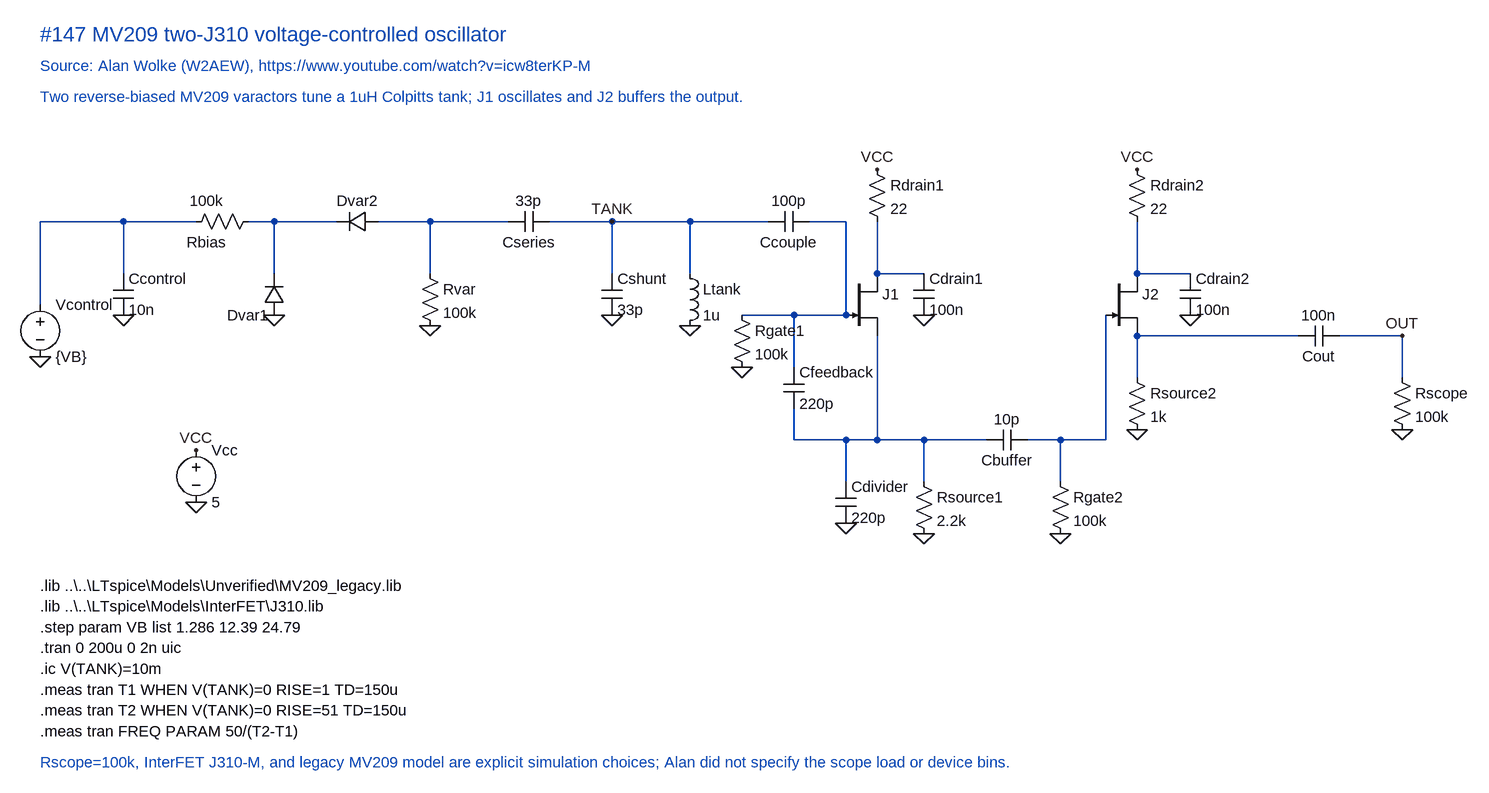
[diagram p0: schematic MV209 two-J310 VCO.asc]
MV209 two-J310 VCO.asc, the LTspice schematic file:
Version 4.1
SHEET 1 2450 1050
WIRE 128 0 0 0
WIRE 240 0 128 0
WIRE 360 0 320 0
WIRE 456 0 360 0
WIRE 600 0 520 0
WIRE 720 0 600 0
WIRE 880 0 784 0
WIRE 1000 0 880 0
WIRE 1120 0 1000 0
WIRE 1240 0 1184 0
WIRE 0 128 0 0
WIRE 128 80 128 0
WIRE 360 80 360 0
WIRE 600 80 600 0
WIRE 880 80 880 0
WIRE 1000 80 1000 0
WIRE 1240 144 1240 0
WIRE 1080 144 1160 144
WIRE 1160 144 1240 144
WIRE 1160 224 1160 144
WIRE 1288 80 1288 0
WIRE 1360 80 1288 80
WIRE 1288 176 1288 336
WIRE 1160 336 1160 288
WIRE 1240 336 1160 336
WIRE 1288 336 1240 336
WIRE 1360 336 1288 336
WIRE 1456 336 1360 336
WIRE 1570 336 1520 336
WIRE 1640 336 1570 336
WIRE 1640 144 1640 336
WIRE 1570 400 1570 336
WIRE 1240 400 1240 336
WIRE 1360 400 1360 336
WIRE 1688 80 1688 0
WIRE 1770 80 1688 80
WIRE 1688 240 1688 176
WIRE 1936 176 1688 176
WIRE 2096 176 2000 176
WIRE 2096 240 2096 176
FLAG 0 208 0
FLAG 128 144 0
FLAG 360 144 0
FLAG 600 160 0
FLAG 880 144 0
FLAG 1000 160 0
FLAG 1080 224 0
FLAG 1360 144 0
FLAG 1240 464 0
FLAG 1360 480 0
FLAG 1570 480 0
FLAG 1770 144 0
FLAG 1688 320 0
FLAG 2096 320 0
FLAG 2096 176 OUT
FLAG 880 0 TANK
FLAG 1288 -80 VCC
FLAG 1688 -80 VCC
FLAG 240 352 VCC
FLAG 240 432 0
SYMBOL voltage 0 112 R0
SYMATTR InstName Vcontrol
SYMATTR Value {VB}
SYMBOL cap 112 80 R0
SYMATTR InstName Ccontrol
SYMATTR Value 10n
SYMBOL res 224 16 R270
WINDOW 0 0 32 VBottom 2
WINDOW 3 32 32 VTop 2
SYMATTR InstName Rbias
SYMATTR Value 100k
SYMBOL diode 376 144 R180
WINDOW 3 0 0 Invisible 2
SYMATTR InstName Dvar1
SYMATTR Value MV209_LEGACY
SYMBOL diode 520 -16 R90
WINDOW 0 0 32 VBottom 2
WINDOW 3 0 0 Invisible 2
SYMATTR InstName Dvar2
SYMATTR Value MV209_LEGACY
SYMBOL res 584 64 R0
SYMATTR InstName Rvar
SYMATTR Value 100k
SYMBOL cap 720 16 R270
WINDOW 0 0 32 VBottom 2
WINDOW 3 32 32 VTop 2
SYMATTR InstName Cseries
SYMATTR Value 33p
SYMBOL cap 864 80 R0
SYMATTR InstName Cshunt
SYMATTR Value 33p
SYMBOL ind 984 64 R0
SYMATTR InstName Ltank
SYMATTR Value 1u
SYMBOL cap 1120 16 R270
WINDOW 0 0 32 VBottom 2
WINDOW 3 32 32 VTop 2
SYMATTR InstName Ccouple
SYMATTR Value 100p
SYMBOL res 1064 128 R0
SYMATTR InstName Rgate1
SYMATTR Value 100k
SYMBOL res 1272 -96 R0
SYMATTR InstName Rdrain1
SYMATTR Value 22
SYMBOL njf 1240 80 R0
WINDOW 3 0 0 Invisible 2
SYMATTR InstName J1
SYMATTR Value J310-M
SYMBOL cap 1344 80 R0
SYMATTR InstName Cdrain1
SYMATTR Value 100n
SYMBOL cap 1144 224 R0
SYMATTR InstName Cfeedback
SYMATTR Value 220p
SYMBOL cap 1224 400 R0
SYMATTR InstName Cdivider
SYMATTR Value 220p
SYMBOL res 1344 384 R0
SYMATTR InstName Rsource1
SYMATTR Value 2.2k
SYMBOL cap 1456 352 R270
WINDOW 0 0 32 VBottom 2
WINDOW 3 32 32 VTop 2
SYMATTR InstName Cbuffer
SYMATTR Value 10p
SYMBOL res 1554 384 R0
SYMATTR InstName Rgate2
SYMATTR Value 100k
SYMBOL res 1672 -96 R0
SYMATTR InstName Rdrain2
SYMATTR Value 22
SYMBOL njf 1640 80 R0
WINDOW 3 0 0 Invisible 2
SYMATTR InstName J2
SYMATTR Value J310-M
SYMBOL cap 1754 80 R0
SYMATTR InstName Cdrain2
SYMATTR Value 100n
SYMBOL res 1672 224 R0
SYMATTR InstName Rsource2
SYMATTR Value 1k
SYMBOL cap 1936 192 R270
WINDOW 0 0 32 VBottom 2
WINDOW 3 32 32 VTop 2
SYMATTR InstName Cout
SYMATTR Value 100n
SYMBOL res 2080 224 R0
SYMATTR InstName Rscope
SYMATTR Value 100k
SYMBOL voltage 240 336 R0
SYMATTR InstName Vcc
SYMATTR Value 5
TEXT 0 -288 Left 3 ;#147 MV209 two-J310 voltage-controlled oscillator
TEXT 0 -240 Left 2 ;Source: Alan Wolke (W2AEW), https://www.youtube.com/watch?v=icw8terKP-M
TEXT 0 -192 Left 2 ;Two reverse-biased MV209 varactors tune a 1uH Colpitts tank; J1 oscillates and J2 buffers the output.
TEXT 0 560 Left 2 !.lib ..\..\LTspice\Models\Unverified\MV209_legacy.lib
TEXT 0 592 Left 2 !.lib ..\..\LTspice\Models\InterFET\J310.lib
TEXT 0 624 Left 2 !.step param VB list 1.286 12.39 24.79
TEXT 0 656 Left 2 !.tran 0 200u 0 2n uic
TEXT 0 688 Left 2 !.ic V(TANK)=10m
TEXT 0 720 Left 2 !.meas tran T1 WHEN V(TANK)=0 RISE=1 TD=150u
TEXT 0 752 Left 2 !.meas tran T2 WHEN V(TANK)=0 RISE=51 TD=150u
TEXT 0 784 Left 2 !.meas tran FREQ PARAM 50/(T2-T1)
TEXT 0 832 Left 2 ;Rscope=100k, InterFET J310-M, and legacy MV209 model are explicit simulation choices; Alan did not specify the scope load or device bins.

The netlist it stands for:
* MV209 two-J310 VCO.asc
Vcontrol N001 0 {VB}
Ccontrol N001 0 10n
Rbias N001 N002 100k
Dvar1 0 N002 MV209_LEGACY
Dvar2 N003 N002 MV209_LEGACY
Rvar N003 0 100k
Cseries N003 TANK 33p
Cshunt TANK 0 33p
Ltank TANK 0 1u
Ccouple TANK N004 100p
Rgate1 N004 0 100k
Rdrain1 VCC N005 22
J1 N005 N004 N006 J310-M
Cdrain1 N005 0 100n
Cfeedback N004 N006 220p
Cdivider N006 0 220p
Rsource1 N006 0 2.2k
Cbuffer N006 N007 10p
Rgate2 N007 0 100k
Rdrain2 VCC N008 22
J2 N008 N007 N009 J310-M
Cdrain2 N008 0 100n
Rsource2 N009 0 1k
Cout N009 OUT 100n
Rscope OUT 0 100k
Vcc VCC 0 5
.model D D
.lib standard.dio
.model NJF NJF
.model PJF PJF
.lib standard.jft
* #147 MV209 two-J310 voltage-controlled oscillator
* Source: Alan Wolke (W2AEW), https://www.youtube.com/watch?v=icw8terKP-M
* Two reverse-biased MV209 varactors tune a 1uH Colpitts tank; J1 oscillates and J2 buffers the output.
.lib ..\..\LTspice\Models\Unverified\MV209_legacy.lib
.lib ..\..\LTspice\Models\InterFET\J310.lib
.step param VB list 1.286 12.39 24.79
.tran 0 200u 0 2n uic
.ic V(TANK)=10m
.meas tran T1 WHEN V(TANK)=0 RISE=1 TD=150u
.meas tran T2 WHEN V(TANK)=0 RISE=51 TD=150u
.meas tran FREQ PARAM 50/(T2-T1)
* Rscope=100k, InterFET J310-M, and legacy MV209 model are explicit simulation choices; Alan did not specify the scope load or device bins.
.backanno
.end